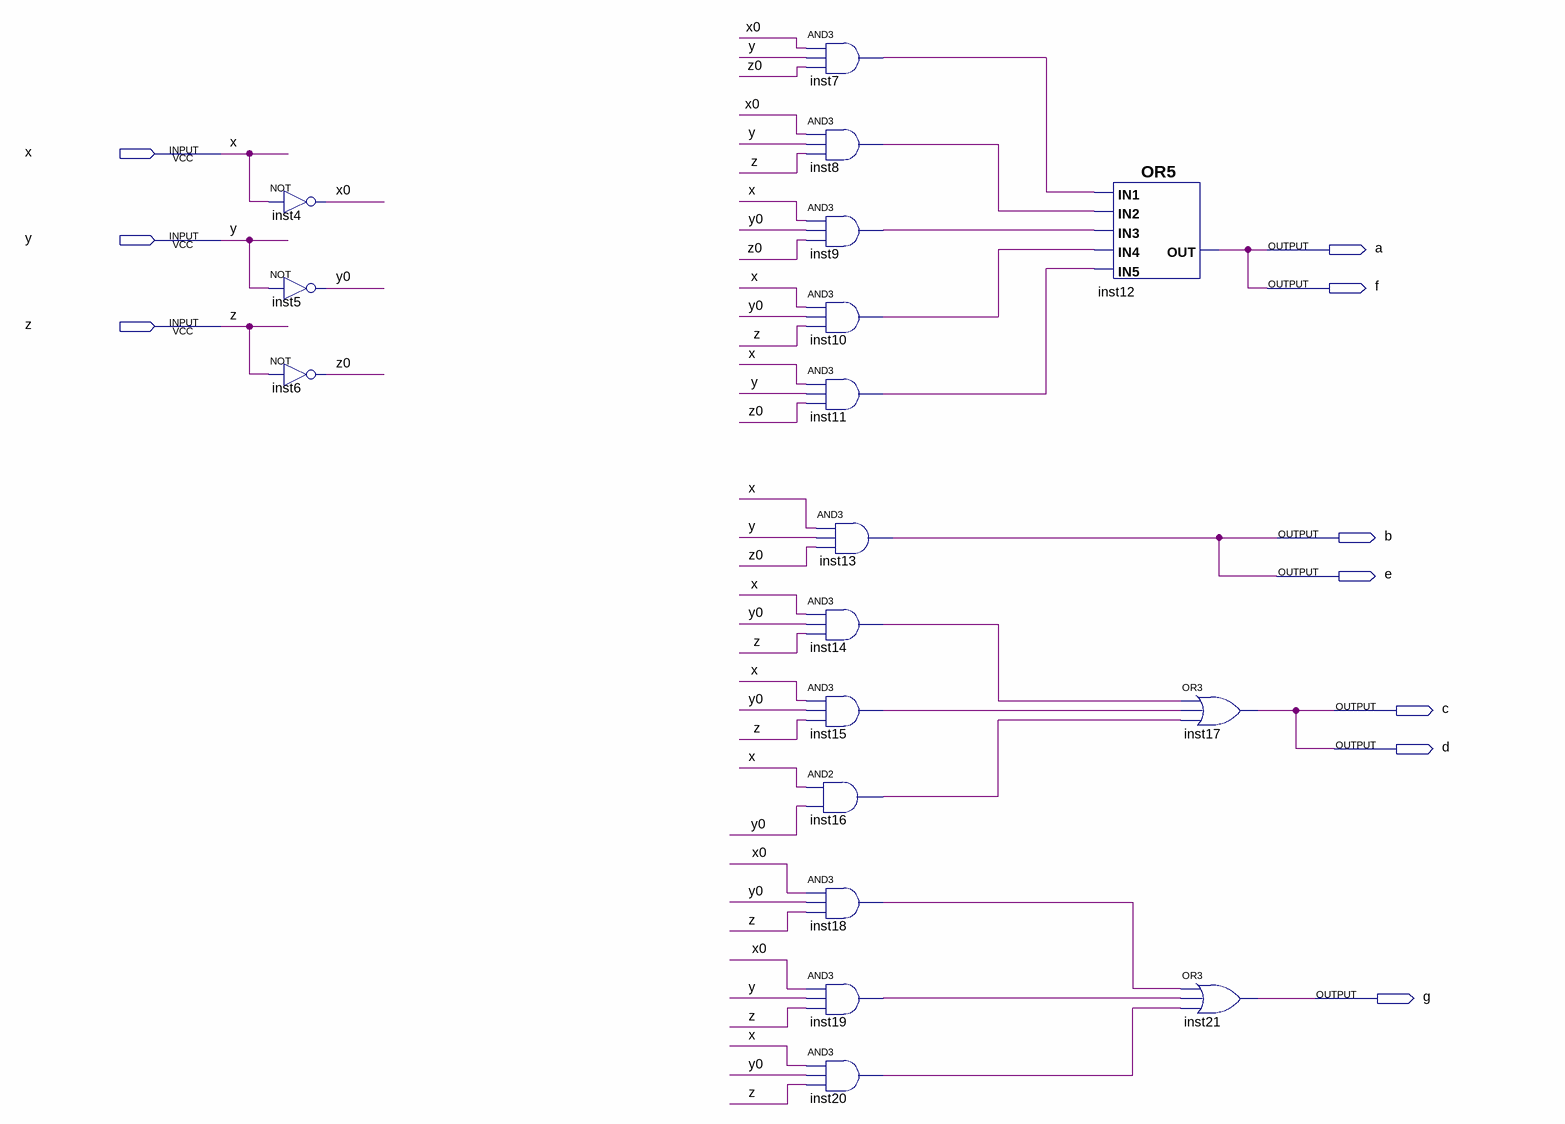
[diagram p0: schematic sheet]
// Quartus schematic CPLD_Dice.bdf as structural Verilog: 18 symbols, 10 pins
module CPLD_Dice (
  input  x,
  input  y,
  input  z,
  output a,
  output f,
  output b,
  output e,
  output c,
  output d,
  output g
);

  wire inst7_out, inst8_out, inst9_out, inst10_out, inst11_out, inst14_out, inst15_out, inst16_out,
       inst18_out, inst19_out, inst20_out, x0, y0, z0;

  not inst4 (x0, x);
  not inst5 (y0, y);
  not inst6 (z0, z);
  and inst7 (inst7_out, x0, y, z0);
  and inst8 (inst8_out, x0, y, z);
  and inst9 (inst9_out, x, y0, z0);
  and inst10 (inst10_out, x, y0, z);
  and inst11 (inst11_out, x, y, z0);
  and inst14 (inst14_out, x, y0, z);
  and inst15 (inst15_out, x, y0, z);
  and inst16 (inst16_out, x, y0);
  and inst18 (inst18_out, x0, y0, z);
  and inst19 (inst19_out, x0, y, z);
  and inst20 (inst20_out, x, y0, z);
  and inst13 (b, x, y, z0);
  or inst12 (a, inst7_out, inst8_out, inst9_out, inst10_out, inst11_out);
  or inst17 (c, inst14_out, inst15_out, inst16_out);
  or inst21 (g, inst18_out, inst19_out, inst20_out);

  assign d = c;
  assign e = b;
  assign f = a;
endmodule
